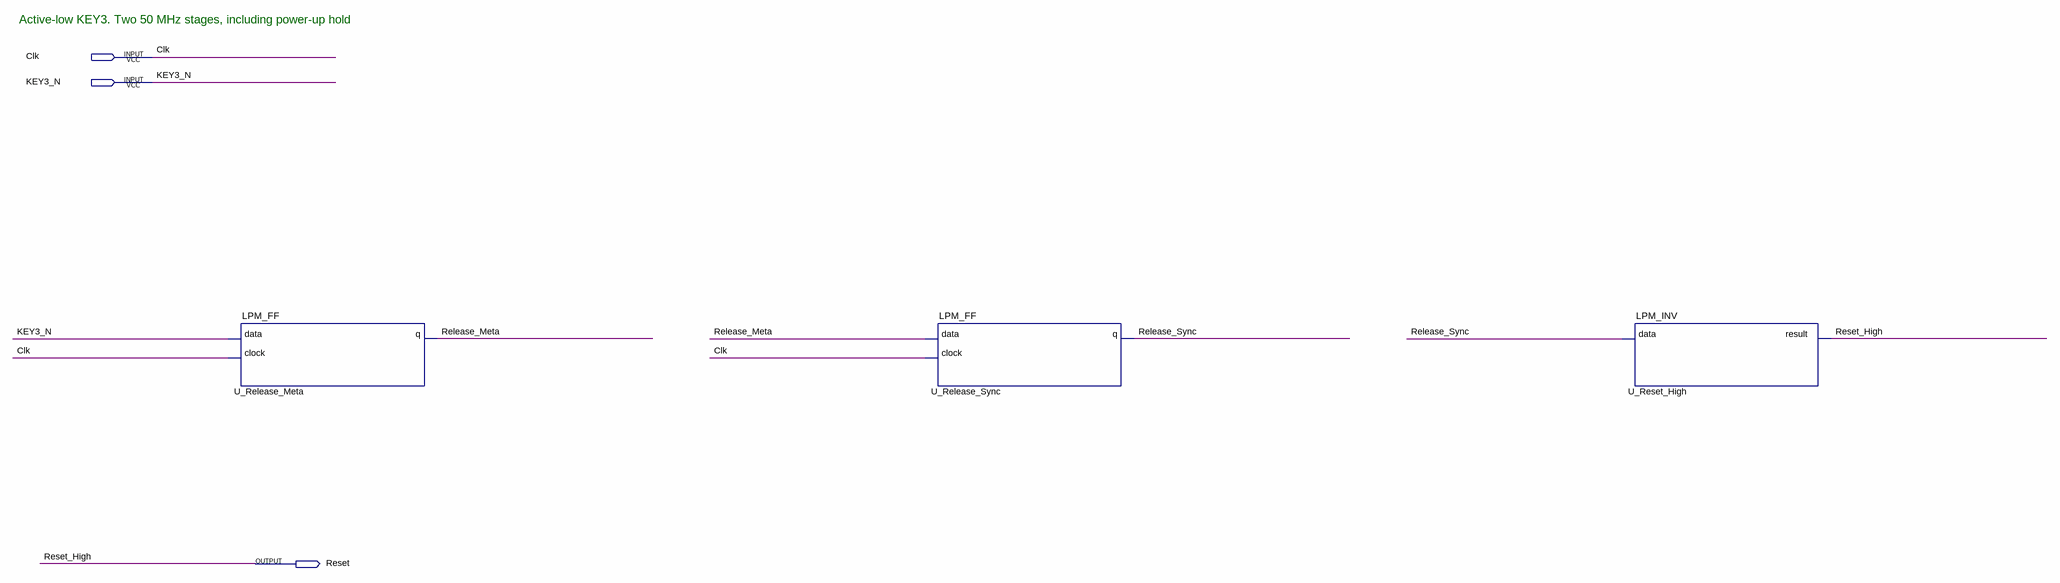
[diagram p0: schematic sheet]
// Quartus schematic Display_Reset.bdf as structural Verilog: 3 symbols, 3 pins
module Display_Reset (
  input  Clk,
  input  KEY3_N,
  output Reset
);

  wire Release_Meta, Release_Sync;

  LPM_FF #(.LPM_WIDTH(1), .LPM_FFTYPE("DFF")) U_Release_Meta (.data(KEY3_N), .clock(Clk), .q(Release_Meta));
  LPM_FF #(.LPM_WIDTH(1), .LPM_FFTYPE("DFF")) U_Release_Sync (.data(Release_Meta), .clock(Clk), .q(Release_Sync));
  LPM_INV #(.LPM_WIDTH(1)) U_Reset_High (.data(Release_Sync), .result(Reset));

  // Other names for the same wires on the sheet: Reset_High = Reset

  // Notes on the sheet:
  //   Active-low KEY3. Two 50 MHz stages, including power-up hold
endmodule
